# Altium schematic sheet Servo2.SchDoc
size 420 x 297 mm; SheetNumber: 12; SheetTotal: 26
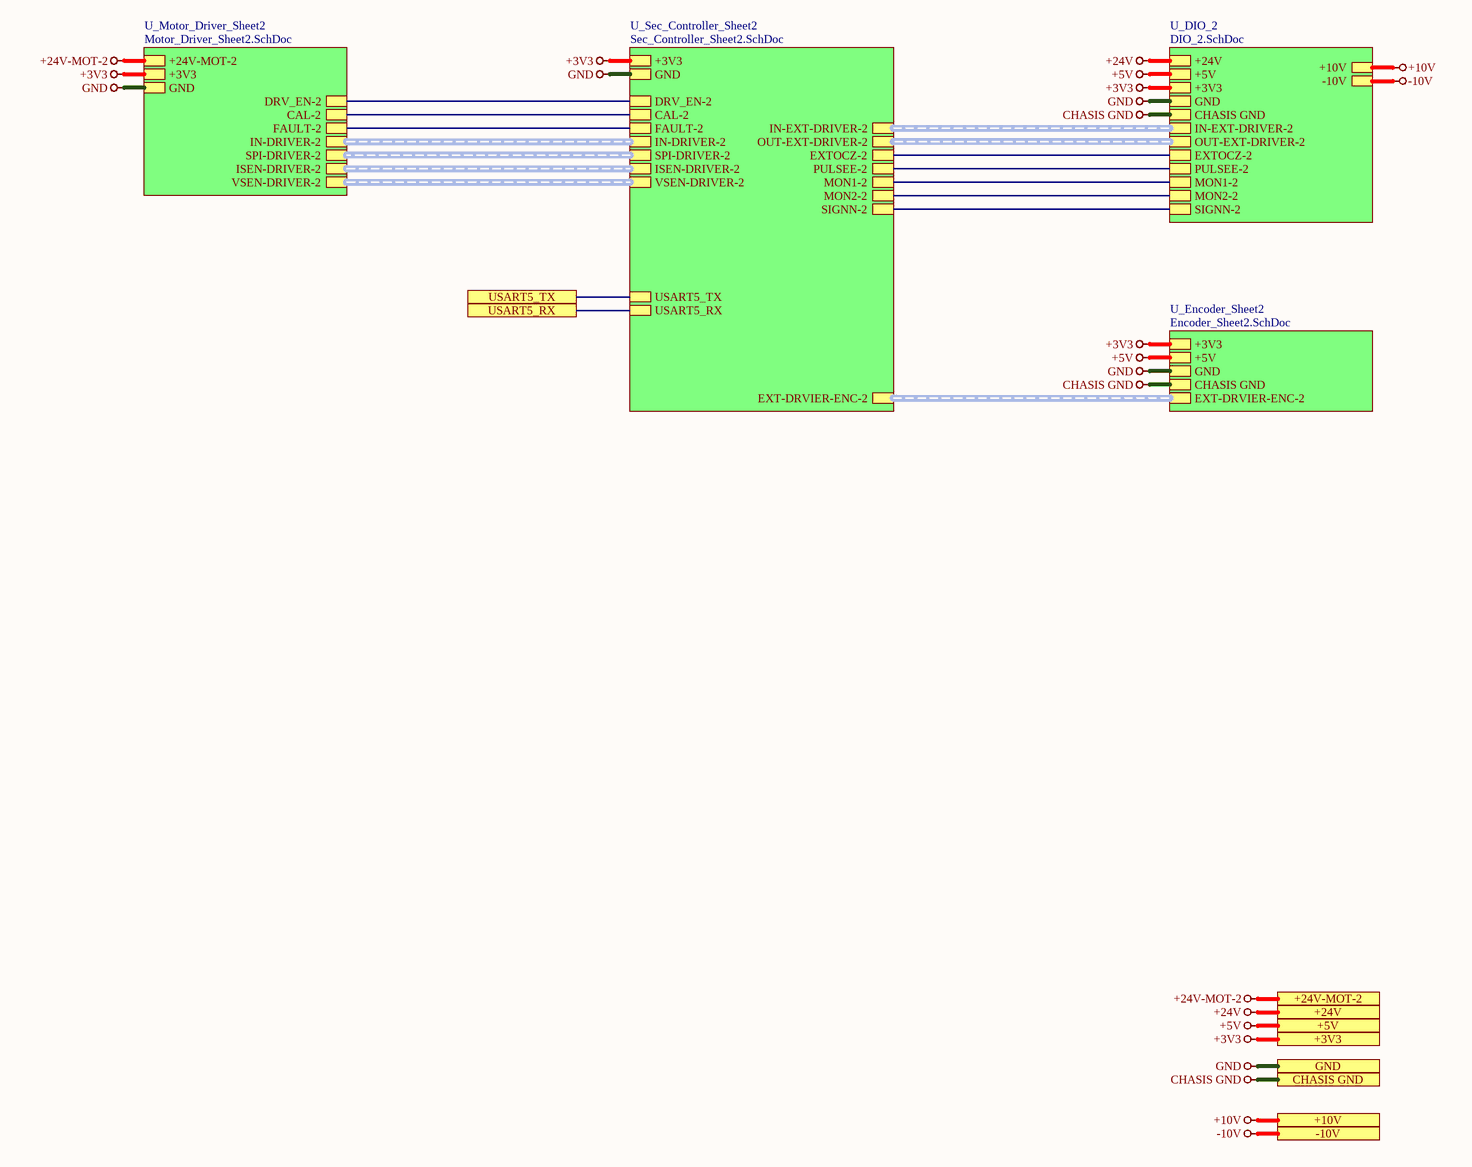
[diagram p0: Servo2.SchDoc]

## Sub-sheets
U_DIO_2 = DIO_2.SchDoc: +24V, +5V, GND, +3V3, CHASIS GND, IN-EXT-DRIVER-2 (harness IN-EXT-DRIVER-2), OUT-EXT-DRIVER-2 (harness OUT-EXT-DRIVER-2), EXTOCZ-2, PULSEE-2, MON1-2, MON2-2, SIGNN-2, +10V, -10V
U_Encoder_Sheet2 = Encoder_Sheet2.SchDoc: +3V3, +5V, GND, CHASIS GND, EXT-DRVIER-ENC-2 (harness EXT-DRVIER-ENC-2)
U_Motor_Driver_Sheet2 = Motor_Driver_Sheet2.SchDoc: +24V-MOT-2, +3V3, GND, DRV_EN-2, CAL-2, FAULT-2, IN-DRIVER-2 (harness IN-DRIVER-2), SPI-DRIVER-2 (harness SPI-DRIVER-2), ISEN-DRIVER-2 (harness ISEN-DRIVER-2), VSEN-DRIVER-2 (harness VSEN-DRIVER-2)
U_Sec_Controller_Sheet2 = Sec_Controller_Sheet2.SchDoc: +3V3, GND, IN-DRIVER-2 (harness IN-DRIVER-2), DRV_EN-2, CAL-2, FAULT-2, SPI-DRIVER-2 (harness SPI-DRIVER-2), ISEN-DRIVER-2 (harness ISEN-DRIVER-2), EXT-DRVIER-ENC-2 (harness EXT-DRVIER-ENC-2), IN-EXT-DRIVER-2 (harness IN-EXT-DRIVER-2), OUT-EXT-DRIVER-2 (harness OUT-EXT-DRIVER-2), EXTOCZ-2, PULSEE-2, MON1-2, MON2-2, SIGNN-2, USART5_TX, USART5_RX, VSEN-DRIVER-2 (harness VSEN-DRIVER-2)

## Ports
+3V3 (see Top_Sheet[5B], CAN_Sheet[4D], Controller_Sheet[5D], DIO_1[5D], DIO_2[5D], DIO_3[5D], DIO_4[5D], Encoder_Sheet1[5D], Encoder_Sheet2[4D], Encoder_Sheet3[4D], Encoder_Sheet4[5D], EtherCAT_Sheet[5D], Motor_Driver_Sheet1[5D], Motor_Driver_Sheet2[5D], Motor_Driver_Sheet3[5D], Motor_Driver_Sheet4[5D], Power_Sheet[5D], RS485_RS232_Sheet[5D], Sec_Controller_Sheet1[5D], Sec_Controller_Sheet2[5D], Sec_Controller_Sheet3[5D], Sec_Controller_Sheet4[5D], Servo1[5D], Servo3[5D], Servo4[5D]), +5V (see Top_Sheet[5B], CAN_Sheet[4D], Controller_Sheet[5D], DIO_1[5D], DIO_2[5D], DIO_3[5D], DIO_4[5D], Encoder_Sheet1[5D], Encoder_Sheet2[4D], Encoder_Sheet3[4D], Encoder_Sheet4[5D], Power_Sheet[5D], Servo1[5D], Servo3[5D], Servo4[5D]), +10V (see Top_Sheet[5B], DIO_1[5D], DIO_2[5D], DIO_3[5D], DIO_4[5D], Power_Sheet[5D], Servo1[5D], Servo3[5D], Servo4[5D]), +24V (see Top_Sheet[5B], DIO_1[5D], DIO_2[5D], DIO_3[5D], DIO_4[5D], Power_Sheet[5D], Servo1[5D], Servo3[5D], Servo4[5D]), +24V-MOT-2 (see Top_Sheet[5B], Motor_Driver_Sheet2[5D], Power_Sheet[5D]), -10V (see Top_Sheet[5B], DIO_1[5D], DIO_2[5D], DIO_3[5D], DIO_4[5D], Power_Sheet[5D], Servo1[5D], Servo3[5D], Servo4[5D]), CHASIS GND (see Top_Sheet[5B], DIO_1[5D], DIO_2[5D], DIO_3[5D], DIO_4[5D], Encoder_Sheet1[5D], Encoder_Sheet2[4D], Encoder_Sheet3[4D], Encoder_Sheet4[5D], EtherCAT_Sheet[5D], Power_Sheet[5D], Servo1[5D], Servo3[5D], Servo4[5D]), GND (see Top_Sheet[5B], CAN_Sheet[4D], Controller_Sheet[5D], DIO_1[5D], DIO_2[5D], DIO_3[5D], DIO_4[5D], Encoder_Sheet1[5D], Encoder_Sheet2[4D], Encoder_Sheet3[4D], Encoder_Sheet4[5D], EtherCAT_Sheet[5D], Motor_Driver_Sheet1[5D], Motor_Driver_Sheet2[5D], Motor_Driver_Sheet3[5D], Motor_Driver_Sheet4[5D], Power_Sheet[5D], RS485_RS232_Sheet[5D], Sec_Controller_Sheet1[5D], Sec_Controller_Sheet2[5D], Sec_Controller_Sheet3[5D], Sec_Controller_Sheet4[5D], Servo1[5D], Servo3[5D], Servo4[5D]), USART5_RX (see Top_Sheet[5B], Controller_Sheet[4D], Sec_Controller_Sheet2[5D]), USART5_TX (see Top_Sheet[5B], Controller_Sheet[4D], Sec_Controller_Sheet2[5D])

## Nets
+3V3: port +3V3, sheet U_Sec_Controller_Sheet2/+3V3, sheet U_Motor_Driver_Sheet2/+3V3, sheet U_Encoder_Sheet2/+3V3, sheet U_DIO_2/+3V3
+5V: port +5V, sheet U_Encoder_Sheet2/+5V, sheet U_DIO_2/+5V
+10V: port +10V, sheet U_DIO_2/+10V
+24V: port +24V, sheet U_DIO_2/+24V
+24V-MOT-2: port +24V-MOT-2, sheet U_Motor_Driver_Sheet2/+24V-MOT-2
-10V: port -10V, sheet U_DIO_2/-10V
CHASIS GND: port CHASIS GND, sheet U_Encoder_Sheet2/CHASIS GND, sheet U_DIO_2/CHASIS GND
GND: port GND, sheet U_Sec_Controller_Sheet2/GND, sheet U_Motor_Driver_Sheet2/GND, sheet U_Encoder_Sheet2/GND, sheet U_DIO_2/GND
USART5_RX: port USART5_RX, sheet U_Sec_Controller_Sheet2/USART5_RX
USART5_TX: port USART5_TX, sheet U_Sec_Controller_Sheet2/USART5_TX
(unnamed): sheet U_Sec_Controller_Sheet2/DRV_EN-2, sheet U_Motor_Driver_Sheet2/DRV_EN-2
(unnamed): sheet U_Sec_Controller_Sheet2/CAL-2, sheet U_Motor_Driver_Sheet2/CAL-2
(unnamed): sheet U_Sec_Controller_Sheet2/FAULT-2, sheet U_Motor_Driver_Sheet2/FAULT-2
(unnamed): sheet U_Sec_Controller_Sheet2/EXTOCZ-2, sheet U_DIO_2/EXTOCZ-2
(unnamed): sheet U_Sec_Controller_Sheet2/PULSEE-2, sheet U_DIO_2/PULSEE-2
(unnamed): sheet U_Sec_Controller_Sheet2/MON1-2, sheet U_DIO_2/MON1-2
(unnamed): sheet U_Sec_Controller_Sheet2/MON2-2, sheet U_DIO_2/MON2-2
(unnamed): sheet U_Sec_Controller_Sheet2/SIGNN-2, sheet U_DIO_2/SIGNN-2

## Buses and harness runs
harness sheet U_DIO_2/IN-EXT-DRIVER-2 = sheet U_Sec_Controller_Sheet2/IN-EXT-DRIVER-2
harness sheet U_DIO_2/OUT-EXT-DRIVER-2 = sheet U_Sec_Controller_Sheet2/OUT-EXT-DRIVER-2
harness sheet U_Encoder_Sheet2/EXT-DRVIER-ENC-2 = sheet U_Sec_Controller_Sheet2/EXT-DRVIER-ENC-2
harness sheet U_Motor_Driver_Sheet2/IN-DRIVER-2 = sheet U_Sec_Controller_Sheet2/IN-DRIVER-2
harness sheet U_Motor_Driver_Sheet2/ISEN-DRIVER-2 = sheet U_Sec_Controller_Sheet2/ISEN-DRIVER-2
harness sheet U_Motor_Driver_Sheet2/SPI-DRIVER-2 = sheet U_Sec_Controller_Sheet2/SPI-DRIVER-2
harness sheet U_Motor_Driver_Sheet2/VSEN-DRIVER-2 = sheet U_Sec_Controller_Sheet2/VSEN-DRIVER-2

## Notes on the sheet
- File:
- Title:
- Date:
- Page
- Num:
- Total:
- Drawn By: Huzaifa Ali